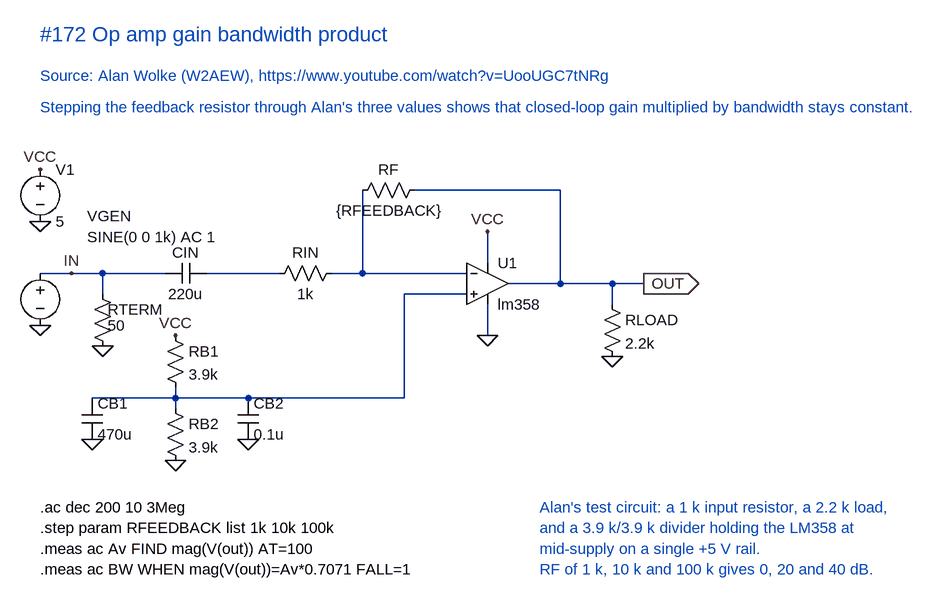
[diagram p0: schematic Gain bandwidth product.asc]
Gain bandwidth product.asc, the LTspice schematic file:
Version 4.1
SHEET 1 1240 920
WIRE 112 400 208 400
WIRE 208 400 208 432
WIRE 208 400 304 400
WIRE 368 400 480 400
WIRE 560 400 768 400
WIRE 608 272 608 400
WIRE 688 272 912 272
WIRE 912 272 912 416
WIRE 832 416 1040 416
WIRE 992 416 992 448
WIRE 320 576 320 608
WIRE 192 592 320 592
WIRE 320 592 432 592
WIRE 432 592 672 592
WIRE 672 592 672 432
WIRE 672 432 768 432
WIRE 800 384 800 336
WIRE 800 448 800 496
FLAG 112 480 0
FLAG 208 512 0
FLAG 192 656 0
FLAG 432 656 0
FLAG 320 688 0
FLAG 320 496 VCC
FLAG 800 336 VCC
FLAG 800 496 0
FLAG 112 240 VCC
FLAG 112 320 0
FLAG 160 400 IN
FLAG 992 528 0
FLAG 1040 416 OUT
IOPIN 1040 416 Out
SYMBOL voltage 112 224 R0
SYMATTR InstName V1
SYMATTR Value 5
SYMBOL voltage 112 384 R0
WINDOW 0 72 -72 Left 2
WINDOW 3 72 -40 Left 2
SYMATTR InstName VGEN
SYMATTR Value SINE(0 0 1k) AC 1
SYMBOL res 192 416 R0
WINDOW 0 24 40 Left 2
WINDOW 3 24 64 Left 2
SYMATTR InstName RTERM
SYMATTR Value 50
SYMBOL cap 368 384 R90
WINDOW 0 0 32 VBottom 2
WINDOW 3 32 32 VTop 2
SYMATTR InstName CIN
SYMATTR Value 220u
SYMBOL res 576 384 R90
WINDOW 0 0 56 VBottom 2
WINDOW 3 32 56 VTop 2
SYMATTR InstName RIN
SYMATTR Value 1k
SYMBOL res 704 256 R90
WINDOW 0 0 56 VBottom 2
WINDOW 3 32 56 VTop 2
SYMATTR InstName RF
SYMATTR Value {RFEEDBACK}
SYMBOL res 976 432 R0
SYMATTR InstName RLOAD
SYMATTR Value 2.2k
SYMBOL res 304 480 R0
SYMATTR InstName RB1
SYMATTR Value 3.9k
SYMBOL res 304 592 R0
SYMATTR InstName RB2
SYMATTR Value 3.9k
SYMBOL cap 176 592 R0
SYMATTR InstName CB1
SYMATTR Value 470u
SYMBOL cap 416 592 R0
SYMATTR InstName CB2
SYMATTR Value 0.1u
SYMBOL lm358 800 352 R0
SYMATTR InstName U1
TEXT 112 32 Left 3 ;#172 Op amp gain bandwidth product
TEXT 112 96 Left 2 ;Source: Alan Wolke (W2AEW), https://www.youtube.com/watch?v=UooUGC7tNRg
TEXT 112 144 Left 2 ;Stepping the feedback resistor through Alan's three values shows that closed-loop gain multiplied by bandwidth stays constant.
TEXT 112 760 Left 2 !.ac dec 200 10 3Meg
TEXT 112 792 Left 2 !.step param RFEEDBACK list 1k 10k 100k
TEXT 112 824 Left 2 !.meas ac Av FIND mag(V(out)) AT=100
TEXT 112 856 Left 2 !.meas ac BW WHEN mag(V(out))=Av*0.7071 FALL=1
TEXT 880 760 Left 2 ;Alan's test circuit: a 1 k input resistor, a 2.2 k load,
TEXT 880 792 Left 2 ;and a 3.9 k/3.9 k divider holding the LM358 at
TEXT 880 824 Left 2 ;mid-supply on a single +5 V rail.
TEXT 880 856 Left 2 ;RF of 1 k, 10 k and 100 k gives 0, 20 and 40 dB.

The netlist it stands for:
* Gain bandwidth product.asc
V1 VCC 0 5
VGEN IN 0 SINE(0 0 1k) AC 1
RTERM IN 0 50
CIN N001 IN 220u
RIN N002 N001 1k
RF OUT N002 {RFEEDBACK}
RLOAD OUT 0 2.2k
RB1 VCC N003 3.9k
RB2 N003 0 3.9k
CB1 N003 0 470u
CB2 N003 0 0.1u
* U1: lm358 (symbol lm358 not available, pins judged from their places): In+=N003 In-=N002 V+=VCC V-=0 OUT=OUT
* #172 Op amp gain bandwidth product
* Source: Alan Wolke (W2AEW), https://www.youtube.com/watch?v=UooUGC7tNRg
* Stepping the feedback resistor through Alan's three values shows that closed-loop gain multiplied by bandwidth stays constant.
.ac dec 200 10 3Meg
.step param RFEEDBACK list 1k 10k 100k
.meas ac Av FIND mag(V(out)) AT=100
.meas ac BW WHEN mag(V(out))=Av*0.7071 FALL=1
* Alan's test circuit: a 1 k input resistor, a 2.2 k load,
* and a 3.9 k/3.9 k divider holding the LM358 at
* mid-supply on a single +5 V rail.
* RF of 1 k, 10 k and 100 k gives 0, 20 and 40 dB.
.backanno
.end